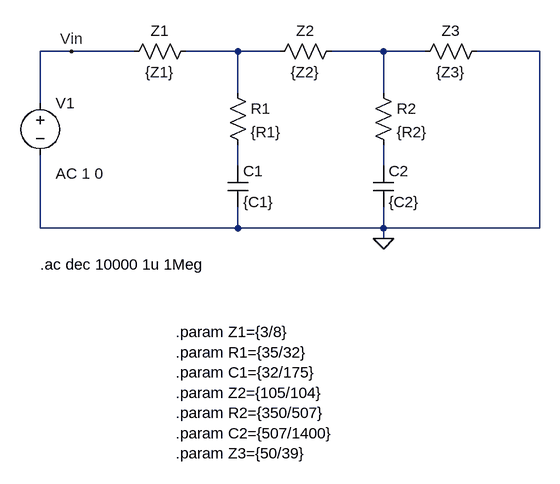
[diagram p0: schematic ejercicio2.asc]
ejercicio2.asc, the LTspice schematic file:
Version 4.1
SHEET 1 880 728
WIRE -48 112 -96 112
WIRE 48 112 -48 112
WIRE 208 112 128 112
WIRE 272 112 208 112
WIRE 432 112 352 112
WIRE 496 112 432 112
WIRE 672 112 576 112
WIRE 208 176 208 112
WIRE 432 176 432 112
WIRE -96 192 -96 112
WIRE 208 288 208 256
WIRE 432 288 432 256
WIRE -96 384 -96 272
WIRE 208 384 208 352
WIRE 208 384 -96 384
WIRE 432 384 432 352
WIRE 432 384 208 384
WIRE 672 384 672 112
WIRE 672 384 432 384
WIRE 432 400 432 384
FLAG -48 112 Vin
FLAG 432 400 0
SYMBOL res 144 96 R90
WINDOW 0 0 56 VBottom 2
WINDOW 3 32 56 VTop 2
SYMATTR InstName Z1
SYMATTR Value {Z1}
SYMBOL res 192 160 R0
SYMATTR InstName R1
SYMATTR Value {R1}
SYMBOL cap 192 288 R0
SYMATTR InstName C1
SYMATTR Value {C1}
SYMBOL res 368 96 R90
WINDOW 0 0 56 VBottom 2
WINDOW 3 32 56 VTop 2
SYMATTR InstName Z2
SYMATTR Value {Z2}
SYMBOL res 416 160 R0
SYMATTR InstName R2
SYMATTR Value {R2}
SYMBOL cap 416 288 R0
SYMATTR InstName C2
SYMATTR Value {C2}
SYMBOL res 592 96 R90
WINDOW 0 0 56 VBottom 2
WINDOW 3 32 56 VTop 2
SYMATTR InstName Z3
SYMATTR Value {Z3}
SYMBOL voltage -96 176 R0
WINDOW 123 24 124 Left 2
WINDOW 39 0 0 Left 0
SYMATTR InstName V1
SYMATTR Value ""
SYMATTR Value2 AC 1 0
TEXT 112 544 Left 2 !.param Z1={3/8}\n.param R1={35/32}\n.param C1={32/175}\n.param Z2={105/104}\n.param R2={350/507}\n.param C2={507/1400}\n.param Z3={50/39}
TEXT -96 440 Left 2 !.ac dec 10000 1u 1Meg

The netlist it stands for:
* ejercicio2.asc
R§Z1 N001 Vin {Z1}
R1 N001 N003 {R1}
C1 N003 0 {C1}
R§Z2 N002 N001 {Z2}
R2 N002 N004 {R2}
C2 N004 0 {C2}
R§Z3 0 N002 {Z3}
V1 Vin 0 AC 1 0
.param Z1={3/8}
.param R1={35/32}
.param C1={32/175}
.param Z2={105/104}
.param R2={350/507}
.param C2={507/1400}
.param Z3={50/39}
.ac dec 10000 1u 1Meg
.backanno
.end